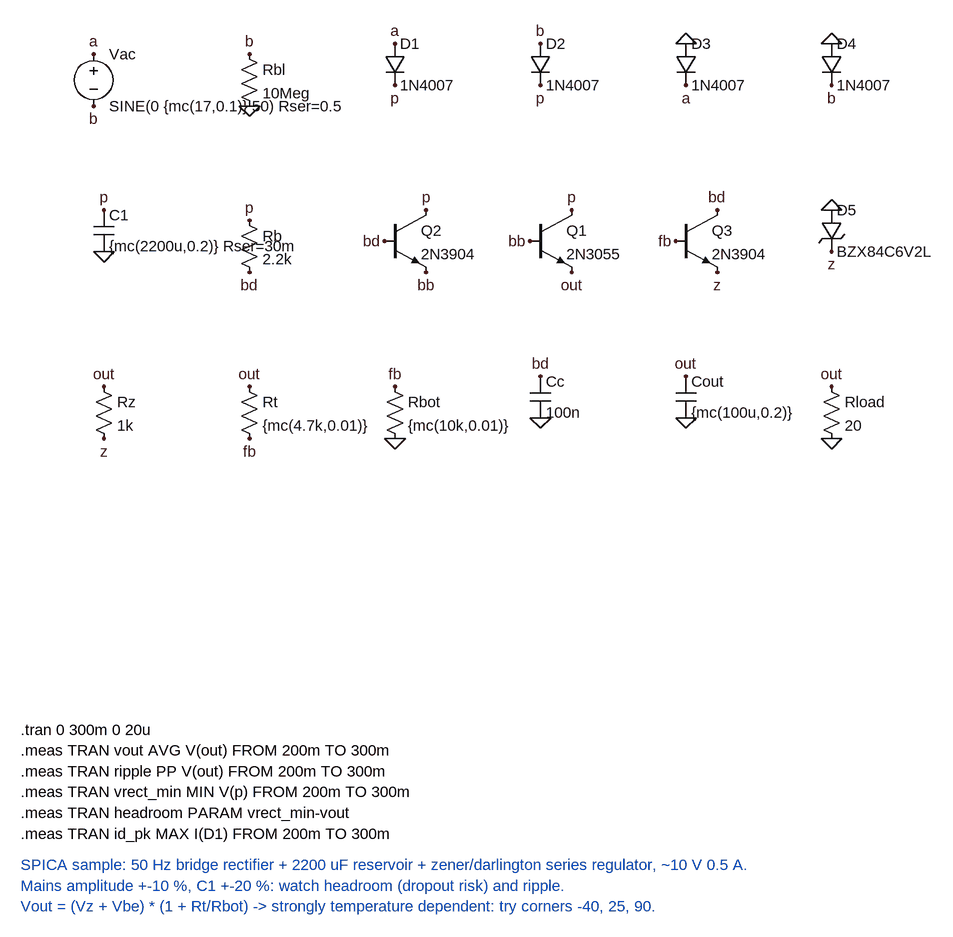
[diagram p0: schematic linear_psu.asc]
linear_psu.asc, the LTspice schematic file:
Version 4
SHEET 1 1600 1200
FLAG 144 80 a
FLAG 144 160 b
FLAG 384 80 b
FLAG 384 160 0
FLAG 608 64 a
FLAG 608 128 p
FLAG 832 64 b
FLAG 832 128 p
FLAG 1056 64 0
FLAG 1056 128 a
FLAG 1280 64 0
FLAG 1280 128 b
FLAG 160 320 p
FLAG 160 384 0
FLAG 384 336 p
FLAG 384 416 bd
FLAG 656 320 p
FLAG 592 368 bd
FLAG 656 416 bb
FLAG 880 320 p
FLAG 816 368 bb
FLAG 880 416 out
FLAG 1104 320 bd
FLAG 1040 368 fb
FLAG 1104 416 z
FLAG 1280 320 0
FLAG 1280 384 z
FLAG 160 592 out
FLAG 160 672 z
FLAG 384 592 out
FLAG 384 672 fb
FLAG 608 592 fb
FLAG 608 672 0
FLAG 832 576 bd
FLAG 832 640 0
FLAG 1056 576 out
FLAG 1056 640 0
FLAG 1280 592 out
FLAG 1280 672 0
SYMBOL voltage 144 64 R0
SYMATTR InstName Vac
SYMATTR Value SINE(0 {mc(17,0.1)} 50) Rser=0.5
SYMBOL res 368 64 R0
SYMATTR InstName Rbl
SYMATTR Value 10Meg
SYMBOL diode 592 64 R0
SYMATTR InstName D1
SYMATTR Value 1N4007
SYMBOL diode 816 64 R0
SYMATTR InstName D2
SYMATTR Value 1N4007
SYMBOL diode 1040 64 R0
SYMATTR InstName D3
SYMATTR Value 1N4007
SYMBOL diode 1264 64 R0
SYMATTR InstName D4
SYMATTR Value 1N4007
SYMBOL cap 144 320 R0
SYMATTR InstName C1
SYMATTR Value {mc(2200u,0.2)} Rser=30m
SYMBOL res 368 320 R0
SYMATTR InstName Rb
SYMATTR Value 2.2k
SYMBOL npn 592 320 R0
SYMATTR InstName Q2
SYMATTR Value 2N3904
SYMBOL npn 816 320 R0
SYMATTR InstName Q1
SYMATTR Value 2N3055
SYMBOL npn 1040 320 R0
SYMATTR InstName Q3
SYMATTR Value 2N3904
SYMBOL zener 1264 320 R0
SYMATTR InstName D5
SYMATTR Value BZX84C6V2L
SYMBOL res 144 576 R0
SYMATTR InstName Rz
SYMATTR Value 1k
SYMBOL res 368 576 R0
SYMATTR InstName Rt
SYMATTR Value {mc(4.7k,0.01)}
SYMBOL res 592 576 R0
SYMATTR InstName Rbot
SYMATTR Value {mc(10k,0.01)}
SYMBOL cap 816 576 R0
SYMATTR InstName Cc
SYMATTR Value 100n
SYMBOL cap 1040 576 R0
SYMATTR InstName Cout
SYMATTR Value {mc(100u,0.2)}
SYMBOL res 1264 576 R0
SYMATTR InstName Rload
SYMATTR Value 20
TEXT 32 1120 Left 2 !.tran 0 300m 0 20u
TEXT 32 1152 Left 2 !.meas TRAN vout AVG V(out) FROM 200m TO 300m
TEXT 32 1184 Left 2 !.meas TRAN ripple PP V(out) FROM 200m TO 300m
TEXT 32 1216 Left 2 !.meas TRAN vrect_min MIN V(p) FROM 200m TO 300m
TEXT 32 1248 Left 2 !.meas TRAN headroom PARAM vrect_min-vout
TEXT 32 1280 Left 2 !.meas TRAN id_pk MAX I(D1) FROM 200m TO 300m
TEXT 32 1328 Left 2 ;SPICA sample: 50 Hz bridge rectifier + 2200 uF reservoir + zener/darlington series regulator, ~10 V 0.5 A.
TEXT 32 1360 Left 2 ;Mains amplitude +-10 %, C1 +-20 %: watch headroom (dropout risk) and ripple.
TEXT 32 1392 Left 2 ;Vout = (Vz + Vbe) * (1 + Rt/Rbot) -> strongly temperature dependent: try corners -40, 25, 90.

The netlist it stands for:
* linear_psu.asc
Vac a b SINE(0 {mc(17,0.1)} 50) Rser=0.5
Rbl b 0 10Meg
D1 a p 1N4007
D2 b p 1N4007
D3 0 a 1N4007
D4 0 b 1N4007
C1 p 0 {mc(2200u,0.2)} Rser=30m
Rb p bd 2.2k
Q2 p bd bb 0 2N3904
Q1 p bb out 0 2N3055
Q3 bd fb z 0 2N3904
D5 0 z BZX84C6V2L
Rz out z 1k
Rt out fb {mc(4.7k,0.01)}
Rbot fb 0 {mc(10k,0.01)}
Cc bd 0 100n
Cout out 0 {mc(100u,0.2)}
Rload out 0 20
.model D D
.lib standard.dio
.model NPN NPN
.model PNP PNP
.lib standard.bjt
.tran 0 300m 0 20u
.meas TRAN vout AVG V(out) FROM 200m TO 300m
.meas TRAN ripple PP V(out) FROM 200m TO 300m
.meas TRAN vrect_min MIN V(p) FROM 200m TO 300m
.meas TRAN headroom PARAM vrect_min-vout
.meas TRAN id_pk MAX I(D1) FROM 200m TO 300m
* SPICA sample: 50 Hz bridge rectifier + 2200 uF reservoir + zener/darlington series regulator, ~10 V 0.5 A.
* Mains amplitude +-10 %, C1 +-20 %: watch headroom (dropout risk) and ripple.
* Vout = (Vz + Vbe) * (1 + Rt/Rbot) -> strongly temperature dependent: try corners -40, 25, 90.
.backanno
.end